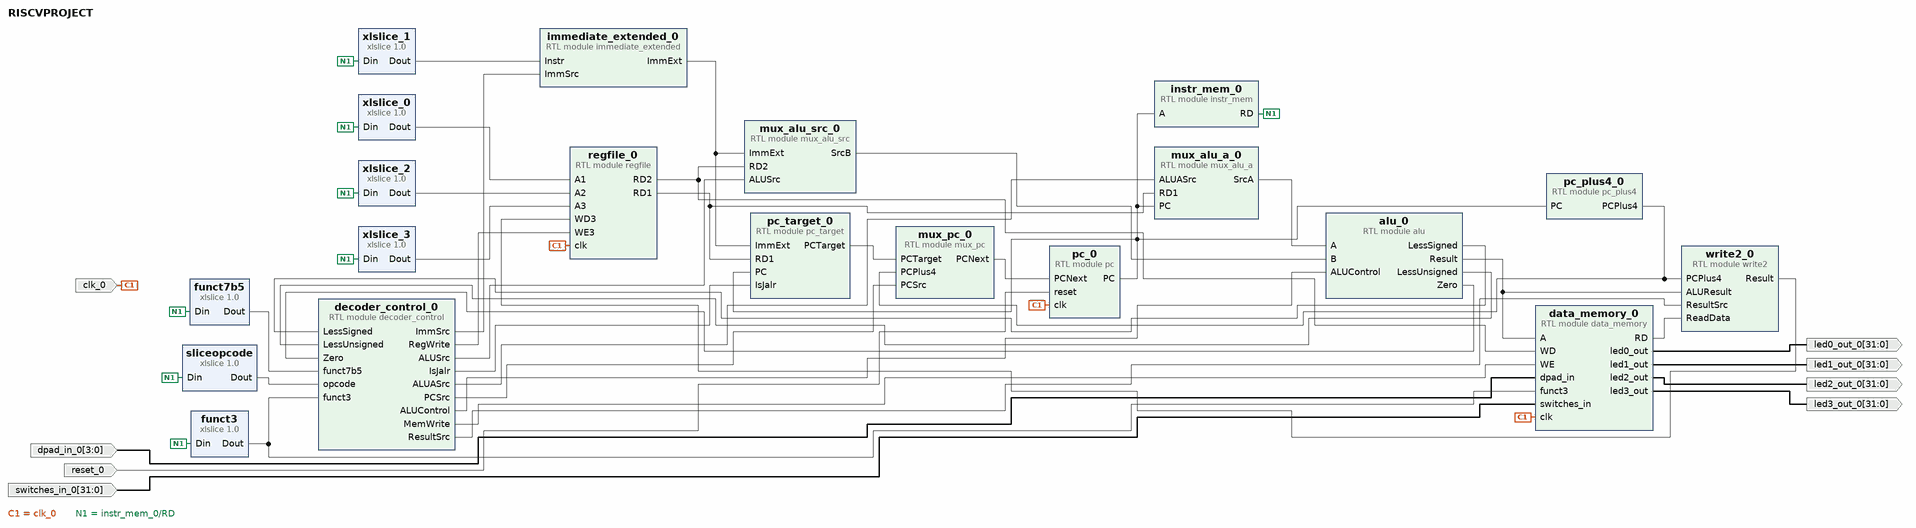
[diagram p0: block diagram of the top level]
# Vivado block design RISCVPROJECT, xc7z010clg400-1, Vivado 2026.1
create_bd_design RISCVPROJECT

create_bd_port -dir I -type clk clk_0
create_bd_port -dir I -type rst reset_0
create_bd_port -dir I -from 31 -to 0 switches_in_0
create_bd_port -dir I -from 3 -to 0 dpad_in_0
create_bd_port -dir O -from 31 -to 0 led1_out_0
create_bd_port -dir O -from 31 -to 0 led0_out_0
create_bd_port -dir O -from 31 -to 0 led3_out_0
create_bd_port -dir O -from 31 -to 0 led2_out_0

create_bd_cell -type module -reference pc pc_0
create_bd_cell -type module -reference instr_mem instr_mem_0
create_bd_cell -type ip -vlnv xilinx.com:ip:xlslice:1.0 xlslice_0
set_property -dict {CONFIG.DIN_FROM 19 CONFIG.DIN_TO 15} [get_bd_cells xlslice_0]
create_bd_cell -type module -reference regfile regfile_0
create_bd_cell -type ip -vlnv xilinx.com:ip:xlslice:1.0 xlslice_1
set_property -dict {CONFIG.DIN_FROM 31 CONFIG.DIN_TO 7} [get_bd_cells xlslice_1]
create_bd_cell -type ip -vlnv xilinx.com:ip:xlslice:1.0 xlslice_2
set_property -dict {CONFIG.DIN_FROM 24 CONFIG.DIN_TO 20} [get_bd_cells xlslice_2]
create_bd_cell -type module -reference alu alu_0
create_bd_cell -type module -reference data_memory data_memory_0
create_bd_cell -type ip -vlnv xilinx.com:ip:xlslice:1.0 xlslice_3
set_property -dict {CONFIG.DIN_FROM 11 CONFIG.DIN_TO 7} [get_bd_cells xlslice_3]
create_bd_cell -type module -reference mux_alu_src mux_alu_src_0
create_bd_cell -type module -reference pc_plus4 pc_plus4_0
create_bd_cell -type module -reference pc_target pc_target_0
create_bd_cell -type module -reference mux_pc mux_pc_0
create_bd_cell -type module -reference decoder_control decoder_control_0
create_bd_cell -type ip -vlnv xilinx.com:ip:xlslice:1.0 sliceopcode
set_property -dict {CONFIG.DIN_FROM 6} [get_bd_cells sliceopcode]
create_bd_cell -type ip -vlnv xilinx.com:ip:xlslice:1.0 funct3
set_property -dict {CONFIG.DIN_FROM 14 CONFIG.DIN_TO 12} [get_bd_cells funct3]
create_bd_cell -type ip -vlnv xilinx.com:ip:xlslice:1.0 funct7b5
set_property -dict {CONFIG.DIN_FROM 30 CONFIG.DIN_TO 30} [get_bd_cells funct7b5]
create_bd_cell -type module -reference immediate_extended immediate_extended_0
create_bd_cell -type module -reference write2 write2_0
create_bd_cell -type module -reference mux_alu_a mux_alu_a_0

# ---- connections ----

connect_bd_net [get_bd_pins alu_0/LessSigned] [get_bd_pins decoder_control_0/LessSigned]
connect_bd_net [get_bd_pins alu_0/LessUnsigned] [get_bd_pins decoder_control_0/LessUnsigned]
connect_bd_net [get_bd_pins alu_0/Result] [get_bd_pins write2_0/ALUResult] [get_bd_pins data_memory_0/A]
connect_bd_net [get_bd_pins alu_0/Zero] [get_bd_pins decoder_control_0/Zero]
connect_bd_net -net clk_0_1 [get_bd_ports clk_0] [get_bd_pins regfile_0/clk] [get_bd_pins data_memory_0/clk] [get_bd_pins pc_0/clk]
connect_bd_net [get_bd_pins data_memory_0/RD] [get_bd_pins write2_0/ReadData]
connect_bd_net [get_bd_pins data_memory_0/led0_out] [get_bd_ports led0_out_0]
connect_bd_net [get_bd_pins data_memory_0/led1_out] [get_bd_ports led1_out_0]
connect_bd_net [get_bd_pins data_memory_0/led2_out] [get_bd_ports led2_out_0]
connect_bd_net [get_bd_pins data_memory_0/led3_out] [get_bd_ports led3_out_0]
connect_bd_net [get_bd_pins decoder_control_0/ALUASrc] [get_bd_pins mux_alu_a_0/ALUASrc]
connect_bd_net [get_bd_pins decoder_control_0/ALUControl] [get_bd_pins alu_0/ALUControl]
connect_bd_net [get_bd_pins decoder_control_0/ALUSrc] [get_bd_pins mux_alu_src_0/ALUSrc]
connect_bd_net [get_bd_pins decoder_control_0/ImmSrc] [get_bd_pins immediate_extended_0/ImmSrc]
connect_bd_net [get_bd_pins decoder_control_0/IsJalr] [get_bd_pins pc_target_0/IsJalr]
connect_bd_net [get_bd_pins decoder_control_0/MemWrite] [get_bd_pins data_memory_0/WE]
connect_bd_net [get_bd_pins decoder_control_0/PCSrc] [get_bd_pins mux_pc_0/PCSrc]
connect_bd_net [get_bd_pins decoder_control_0/RegWrite] [get_bd_pins regfile_0/WE3]
connect_bd_net [get_bd_pins decoder_control_0/ResultSrc] [get_bd_pins write2_0/ResultSrc]
connect_bd_net -net dpad_in_0_1 [get_bd_ports dpad_in_0] [get_bd_pins data_memory_0/dpad_in]
connect_bd_net [get_bd_pins funct3/Dout] [get_bd_pins decoder_control_0/funct3] [get_bd_pins data_memory_0/funct3]
connect_bd_net [get_bd_pins funct7b5/Dout] [get_bd_pins decoder_control_0/funct7b5]
connect_bd_net [get_bd_pins immediate_extended_0/ImmExt] [get_bd_pins mux_alu_src_0/ImmExt] [get_bd_pins pc_target_0/ImmExt]
connect_bd_net [get_bd_pins instr_mem_0/RD] \
  [get_bd_pins xlslice_0/Din] [get_bd_pins xlslice_2/Din] [get_bd_pins xlslice_1/Din] [get_bd_pins xlslice_3/Din] \
  [get_bd_pins sliceopcode/Din] [get_bd_pins funct3/Din] [get_bd_pins funct7b5/Din]
connect_bd_net [get_bd_pins mux_alu_a_0/SrcA] [get_bd_pins alu_0/A]
connect_bd_net [get_bd_pins mux_alu_src_0/SrcB] [get_bd_pins alu_0/B]
connect_bd_net [get_bd_pins mux_pc_0/PCNext] [get_bd_pins pc_0/PCNext]
connect_bd_net [get_bd_pins pc_0/PC] [get_bd_pins pc_plus4_0/PC] [get_bd_pins mux_alu_a_0/PC] [get_bd_pins pc_target_0/PC] [get_bd_pins instr_mem_0/A]
connect_bd_net [get_bd_pins pc_plus4_0/PCPlus4] [get_bd_pins mux_pc_0/PCPlus4] [get_bd_pins write2_0/PCPlus4]
connect_bd_net [get_bd_pins pc_target_0/PCTarget] [get_bd_pins mux_pc_0/PCTarget]
connect_bd_net [get_bd_pins regfile_0/RD1] [get_bd_pins mux_alu_a_0/RD1] [get_bd_pins pc_target_0/RD1]
connect_bd_net [get_bd_pins regfile_0/RD2] [get_bd_pins mux_alu_src_0/RD2] [get_bd_pins data_memory_0/WD]
connect_bd_net -net reset_0_1 [get_bd_ports reset_0] [get_bd_pins pc_0/reset]
connect_bd_net [get_bd_pins sliceopcode/Dout] [get_bd_pins decoder_control_0/opcode]
connect_bd_net -net switches_in_0_1 [get_bd_ports switches_in_0] [get_bd_pins data_memory_0/switches_in]
connect_bd_net [get_bd_pins write2_0/Result] [get_bd_pins regfile_0/WD3]
connect_bd_net [get_bd_pins xlslice_0/Dout] [get_bd_pins regfile_0/A1]
connect_bd_net [get_bd_pins xlslice_1/Dout] [get_bd_pins immediate_extended_0/Instr]
connect_bd_net [get_bd_pins xlslice_2/Dout] [get_bd_pins regfile_0/A2]
connect_bd_net [get_bd_pins xlslice_3/Dout] [get_bd_pins regfile_0/A3]

validate_bd_design
save_bd_design
